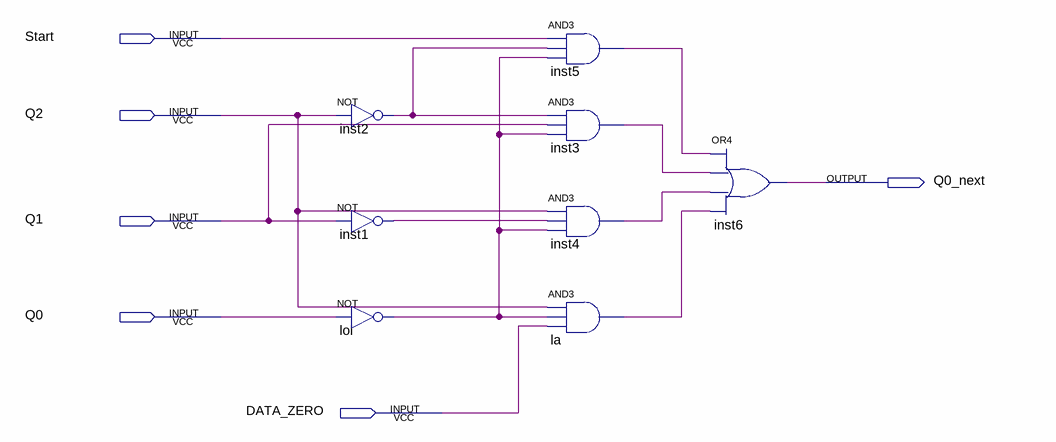
[diagram p0: schematic sheet]
// Quartus schematic Q0_next.bdf as structural Verilog: 8 symbols, 6 pins
module Q0_next (
  input  Start,
  input  Q2,
  input  Q1,
  input  Q0,
  input  DATA_ZERO,
  output Q0_next
);

  wire inst1_out, inst2_out, inst3_out, inst4_out, inst5_out, la_out, lol_out;

  not inst2 (inst2_out, Q2);
  not inst1 (inst1_out, Q1);
  not lol (lol_out, Q0);
  and inst5 (inst5_out, Start, inst2_out, lol_out);
  and inst3 (inst3_out, inst2_out, Q1, lol_out);
  and inst4 (inst4_out, Q2, inst1_out, lol_out);
  and la (la_out, Q2, lol_out, DATA_ZERO);
  or inst6 (Q0_next, inst5_out, inst3_out, inst4_out, la_out);
endmodule
